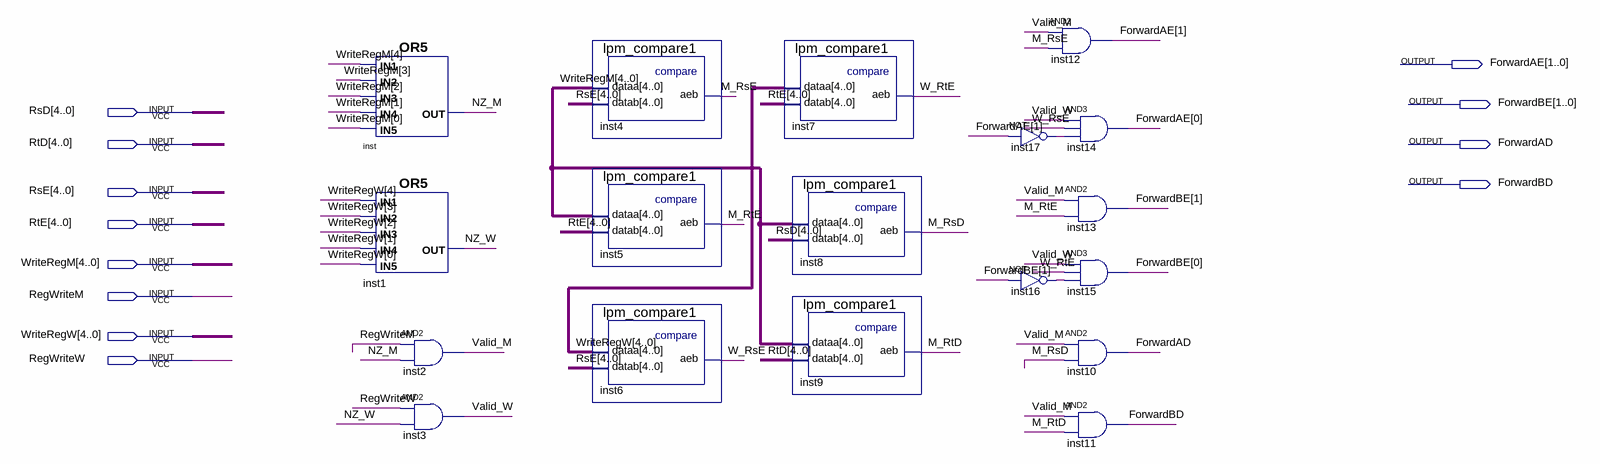
[diagram p0: schematic sheet]
// Quartus schematic Forwarding Unit.bdf as structural Verilog: 18 symbols, 12 pins
module \Forwarding_Unit  (
  input  [4:0] RsD,
  input  [4:0] RtD,
  input  [4:0] RsE,
  input  [4:0] RtE,
  input  [4:0] WriteRegM,
  input  RegWriteM,
  input  [4:0] WriteRegW,
  input  RegWriteW,
  output [1:0] ForwardAE,
  output [1:0] ForwardBE,
  output ForwardAD,
  output ForwardBD
);

  wire inst16_out, inst17_out, M_RsD, M_RsE, M_RtD, M_RtE, NZ_M, NZ_W, Valid_M, Valid_W, W_RsE, W_RtE;

  or inst (NZ_M, WriteRegM[4], WriteRegM[3], WriteRegM[2], WriteRegM[1], WriteRegM[0]);
  or inst1 (NZ_W, WriteRegW[4], WriteRegW[3], WriteRegW[2], WriteRegW[1], WriteRegW[0]);
  and inst2 (Valid_M, RegWriteM, NZ_M);
  and inst3 (Valid_W, RegWriteW, NZ_W);
  lpm_compare1 inst4 (.dataa(WriteRegM), .datab(RsE), .aeb(M_RsE));
  lpm_compare1 inst5 (.dataa(WriteRegM), .datab(RtE), .aeb(M_RtE));
  lpm_compare1 inst6 (.dataa(WriteRegW), .datab(RsE), .aeb(W_RsE));
  lpm_compare1 inst7 (.dataa(WriteRegW), .datab(RtE), .aeb(W_RtE));
  lpm_compare1 inst8 (.dataa(WriteRegM), .datab(RsD), .aeb(M_RsD));
  lpm_compare1 inst9 (.dataa(WriteRegM), .datab(RtD), .aeb(M_RtD));
  not inst17 (inst17_out, ForwardAE[1]);
  not inst16 (inst16_out, ForwardBE[1]);
  and inst12 (ForwardAE[1], Valid_M, M_RsE);
  and inst14 (ForwardAE[0], Valid_W, W_RsE, inst17_out);
  and inst13 (ForwardBE[1], Valid_M, M_RtE);
  and inst15 (ForwardBE[0], Valid_W, W_RtE, inst16_out);
  and inst10 (ForwardAD, Valid_M, M_RsD);
  and inst11 (ForwardBD, Valid_M, M_RtD);
endmodule
